# EAGLE design PCB_ESP32_v6 (EAGLE 9.7.0)
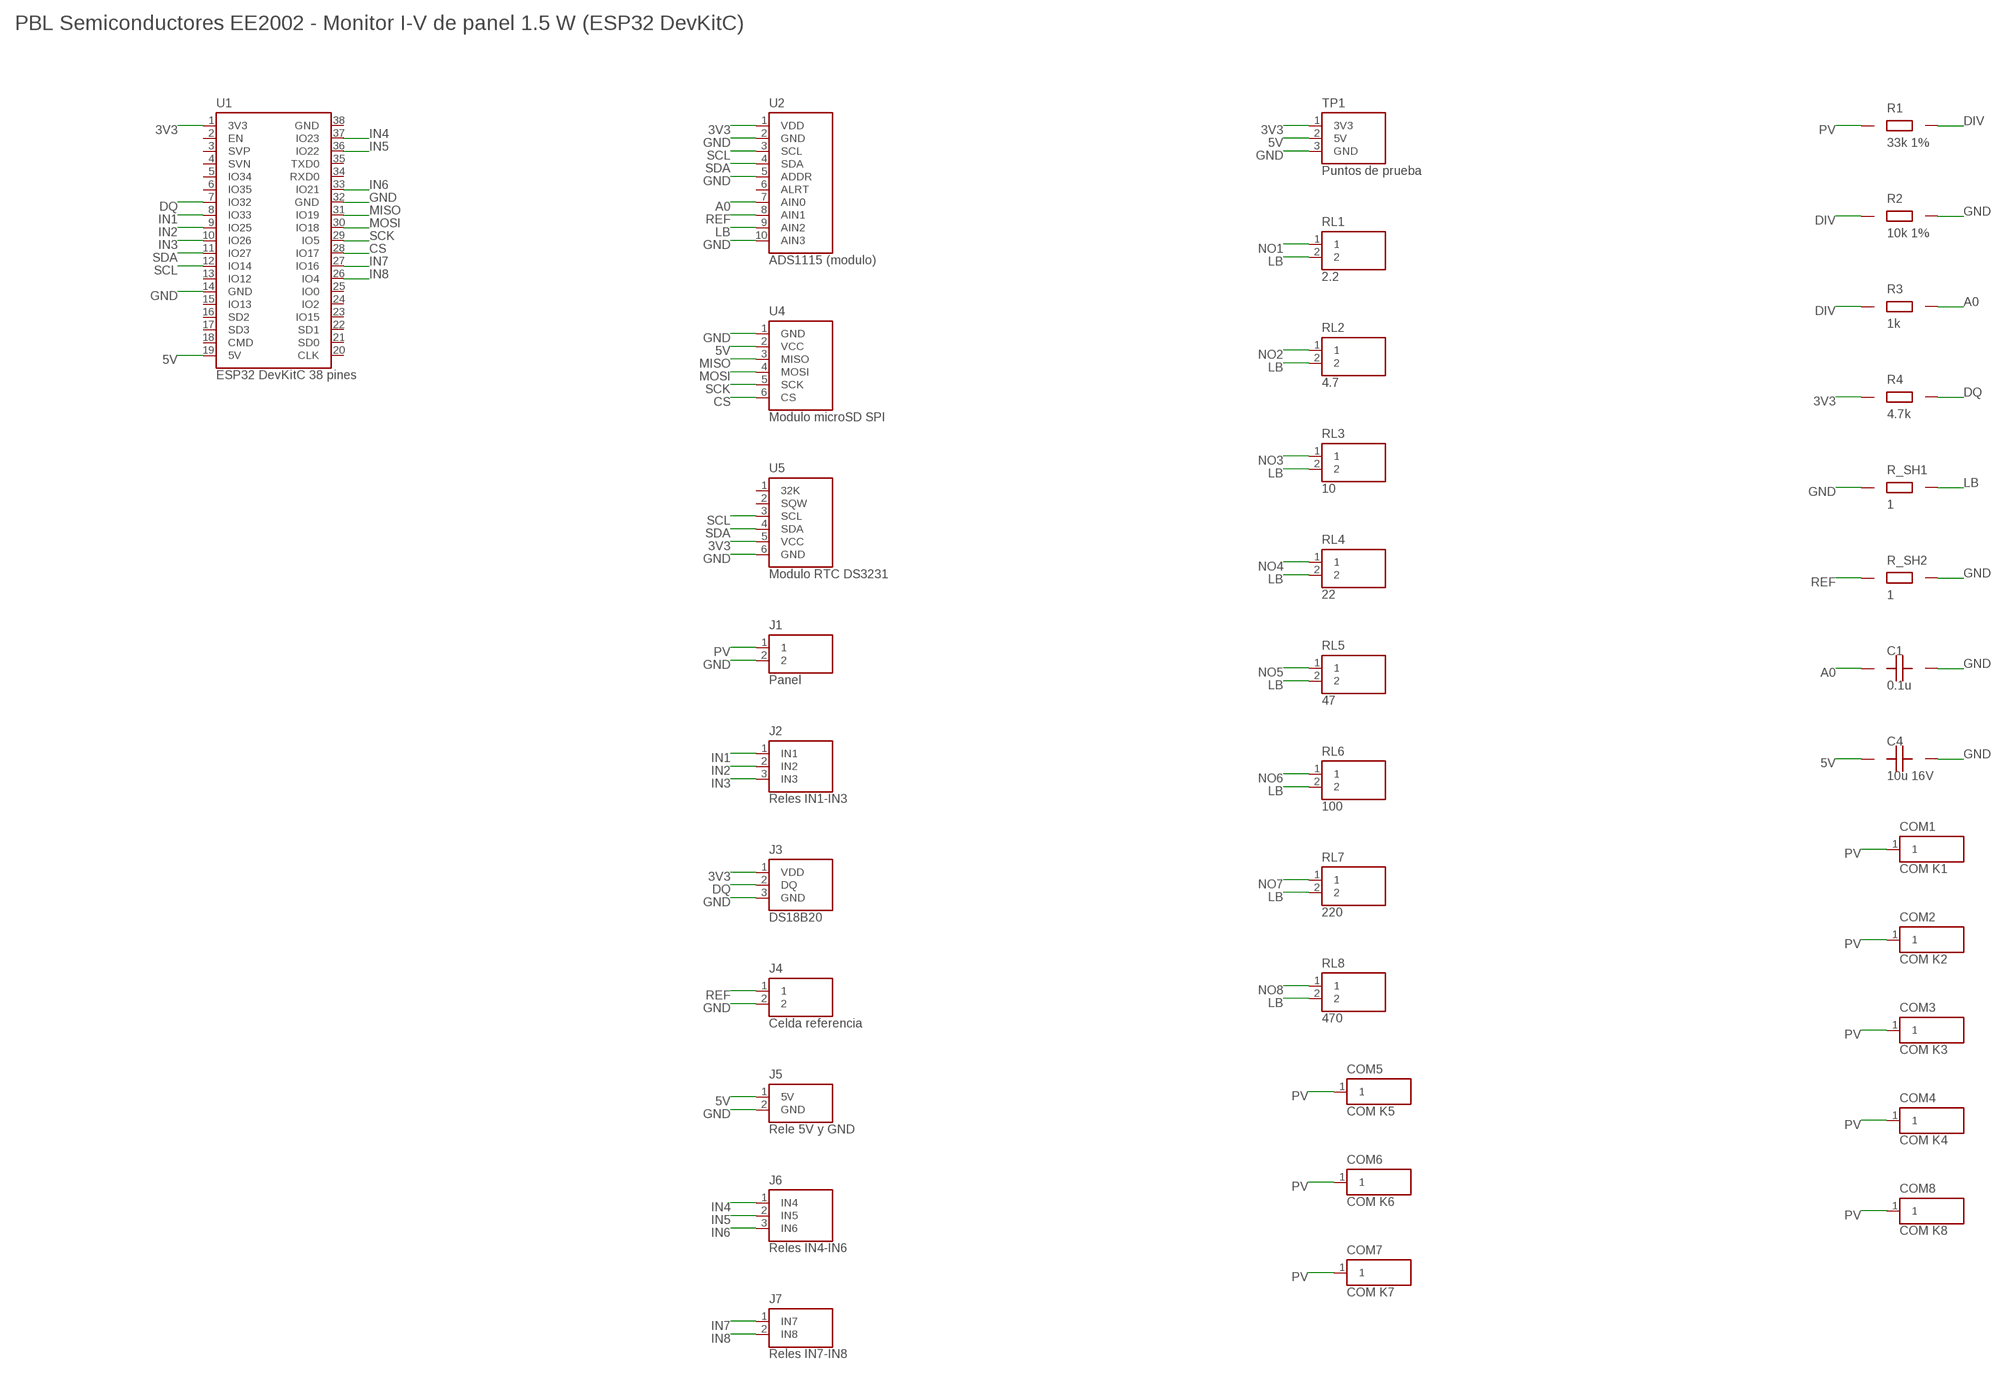
[diagram p0: schematic, sheet 1]

## Parts
C1  0.1u  C  [CAP_5MM]
C4  10u 16V  CP  [CAP_E_2_54]
COM1  COM K1  WIREPAD  [WIREPAD]
COM2  COM K2  WIREPAD  [WIREPAD]
COM3  COM K3  WIREPAD  [WIREPAD]
COM4  COM K4  WIREPAD  [WIREPAD]
COM5  COM K5  WIREPAD  [WIREPAD]
COM6  COM K6  WIREPAD  [WIREPAD]
COM7  COM K7  WIREPAD  [WIREPAD]
COM8  COM K8  WIREPAD  [WIREPAD]
J1  Panel  TERM2  [TERM2_5MM]
J2  Reles IN1-IN3  RELAY_L  [MALE_1X03]
J3  DS18B20  DS18B20_HDR  [MALE_1X03]
J4  Celda referencia  TERM2  [TERM2_5MM]
J5  Rele 5V y GND  RELAY_PWR  [MALE_1X02]
J6  Reles IN4-IN6  RELAY_RA  [MALE_1X03]
J7  Reles IN7-IN8  RELAY_RC  [MALE_1X02]
R1  33k 1%  R  [RES_V]
R2  10k 1%  R  [RES_V]
R3  1k  R  [RES_V]
R4  4.7k  R  [RES_V]
R_SH1  1  R  [RES_V]
R_SH2  1  R  [RES_V]
RL1  2.2  RLOAD  [RES_H_T]
RL2  4.7  RLOAD  [RES_H_T]
RL3  10  RLOAD  [RES_H_T]
RL4  22  RLOAD  [RES_H_T]
RL5  47  RLOAD  [RES_H_T]
RL6  100  RLOAD  [RES_H_T]
RL7  220  RLOAD  [RES_H_T]
RL8  470  RLOAD  [RES_H_T]
TP1  Puntos de prueba  TESTPOINTS  [MALE_1X03]
U1  ESP32 DevKitC 38 pines  ESP32  [ESP32_DEVKIT38]
U2  ADS1115 (modulo)  ADS1115  [SOCKET_1X10]
U4  Modulo microSD SPI  SDCARD  [SOCKET_1X06]
U5  Modulo RTC DS3231  DS3231  [SOCKET_1X06]

## Nets
3V3: J3.1(VDD) R4.1 TP1.1(3V3) U1.1(3V3) U2.1(VDD) U5.5(VCC)
5V: C4.1(+) J5.1(5V) TP1.2(5V) U1.19(5V) U4.2(VCC)
A0: C1.1 R3.2 U2.7(AIN0)
CS: U1.28(IO17) U4.6(CS)
DIV: R1.2 R2.1 R3.1
DQ: J3.2(DQ) R4.2 U1.7(IO32)
GND: C1.2 C4.2(-) J1.2 J3.3(GND) J4.2 J5.2(GND) R2.2 R_SH1.1 R_SH2.2 TP1.3(GND) U1.14(GND) U1.32(GND) U2.2(GND) U2.5(ADDR) U2.10(AIN3) U4.1(GND) U5.6(GND)
IN1: J2.1(IN1) U1.8(IO33)
IN2: J2.2(IN2) U1.9(IO25)
IN3: J2.3(IN3) U1.10(IO26)
IN4: J6.1(IN4) U1.37(IO23)
IN5: J6.2(IN5) U1.36(IO22)
IN6: J6.3(IN6) U1.33(IO21)
IN7: J7.1(IN7) U1.27(IO16)
IN8: J7.2(IN8) U1.26(IO4)
LB: R_SH1.2 RL1.2 RL2.2 RL3.2 RL4.2 RL5.2 RL6.2 RL7.2 RL8.2 U2.9(AIN2)
MISO: U1.31(IO19) U4.3(MISO)
MOSI: U1.30(IO18) U4.4(MOSI)
NO1: RL1.1
NO2: RL2.1
NO3: RL3.1
NO4: RL4.1
NO5: RL5.1
NO6: RL6.1
NO7: RL7.1
NO8: RL8.1
PV: COM1.1 COM2.1 COM3.1 COM4.1 COM5.1 COM6.1 COM7.1 COM8.1 J1.1 R1.1
REF: J4.1 R_SH2.1 U2.8(AIN1)
SCK: U1.29(IO5) U4.5(SCK)
SCL: U1.12(IO14) U2.3(SCL) U5.3(SCL)
SDA: U1.11(IO27) U2.4(SDA) U5.4(SDA)
Unconnected: U1.2(EN) U1.3(SVP) U1.4(SVN) U1.5(IO34) U1.6(IO35) U1.13(IO12) U1.15(IO13) U1.16(SD2) U1.17(SD3) U1.18(CMD) U1.20(CLK) U1.21(SD0) U1.22(SD1) U1.23(IO15) U1.24(IO2) U1.25(IO0) U1.34(RXD0) U1.35(TXD0) U1.38(GND) U2.6(ALRT) U5.1(32K) U5.2(SQW)

## Notes on the sheet
- PBL Semiconductores EE2002 - Monitor I-V de panel 1.5 W (ESP32 DevKitC)

## Library data of the parts
C1 = PCB_PBL_Semiconductores:C
C4 = PCB_PBL_Semiconductores:CP
COM1-COM8 = PCB_PBL_Semiconductores:WIREPAD
J1 J4 = PCB_PBL_Semiconductores:TERM2
J2 = PCB_PBL_Semiconductores:RELAY_L
J3 = PCB_PBL_Semiconductores:DS18B20_HDR
J5 = PCB_PBL_Semiconductores:RELAY_PWR
J6 = PCB_PBL_Semiconductores:RELAY_RA
J7 = PCB_PBL_Semiconductores:RELAY_RC
R1-R4 R_SH1 R_SH2 = PCB_PBL_Semiconductores:R
RL1-RL8 = PCB_PBL_Semiconductores:RLOAD
TP1 = PCB_PBL_Semiconductores:TESTPOINTS
U1 = PCB_PBL_Semiconductores:ESP32
U2 = PCB_PBL_Semiconductores:ADS1115
U4 = PCB_PBL_Semiconductores:SDCARD
U5 = PCB_PBL_Semiconductores:DS3231

## Board
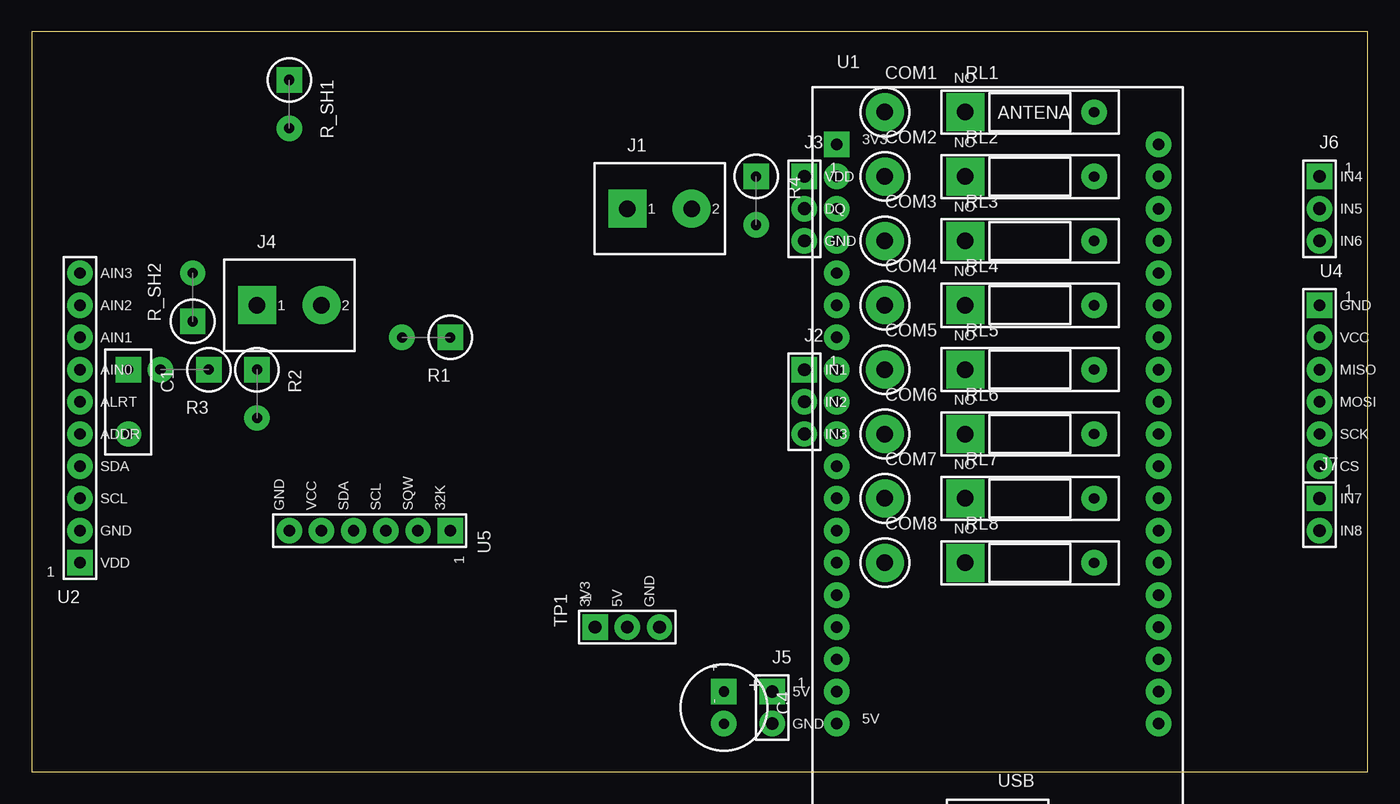
[diagram p1: board, top side]
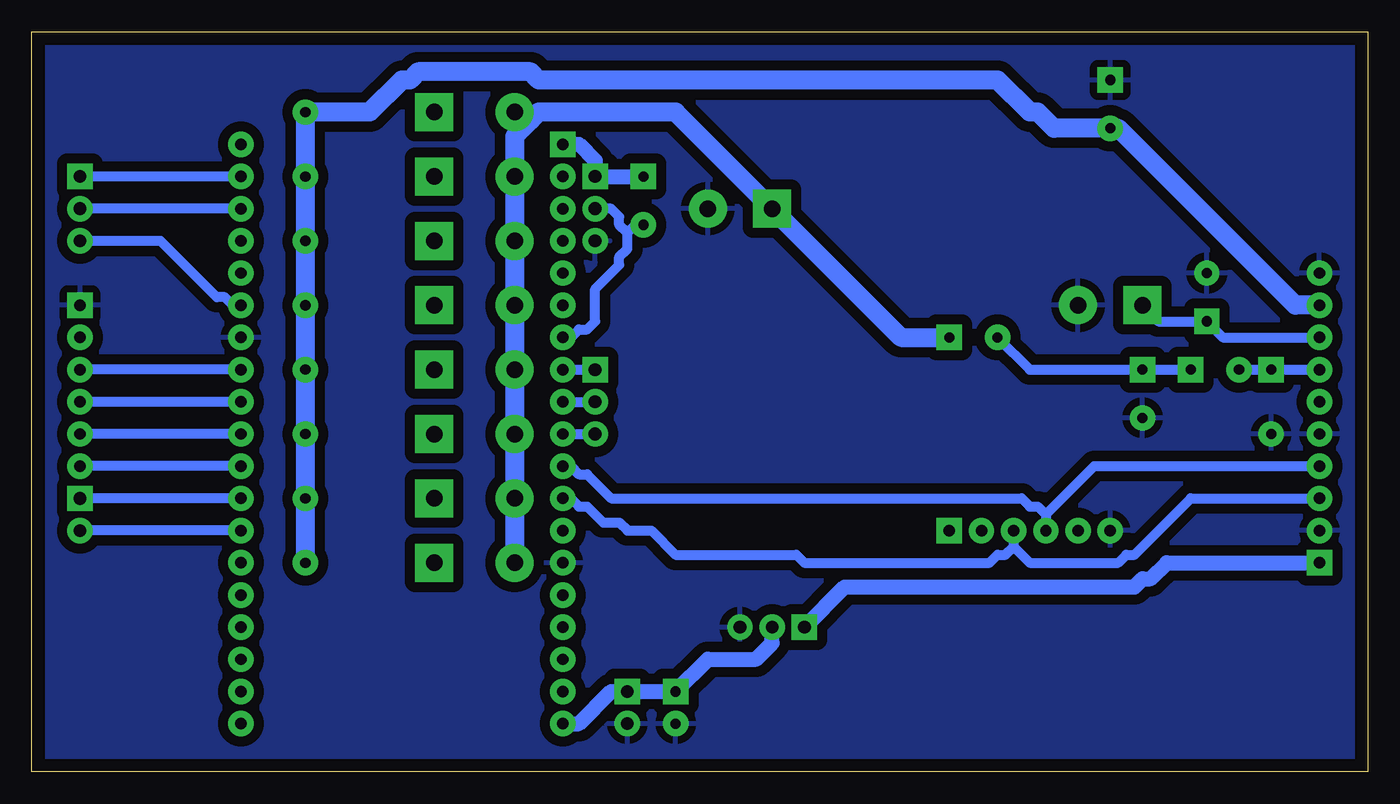
[diagram p2: board, bottom side, seen from below]

Size 105.41 x 58.42 mm. Coordinates in mm from the lower left corner, seen from the top.
Outline: 0,0 105.41,0 105.41,58.42 0,58.42 0,0
Copper layers (1*16): Top 0.035mm / dielectric 1.5mm / Bottom 0.035mm
Design rules "Fusion Electronics Design Rules": minimum track width 0.5mm, minimum drill 0.5mm, track to track 0.5mm, track to pad 0.5mm, pad to pad 0.5mm, via to via 0.5mm, smd to smd 6mil, copper to edge 1mm, drill to drill 0.3mm, minimum pad ring 0.4mm, minimum via ring 0.4mm, stop-mask expansion 4mil, vias tented up to drill 9999mil, thermal gap 0.6mm

### Footprints (pad centres in the part's own frame; a part is rotated, then mirrored left to right if it is on the bottom)
CAP_5MM = drill 0.8 pad 2 square: 1 0,0 | drill 0.8 pad 2 round: 2 5.08,0
CAP_E_2_54 = drill 0.8 pad 2 square: 1 0,0 | drill 0.8 pad 2 round: 2 2.54,0
WIREPAD = drill 1.3 pad 3 round: 1 0,0
TERM2_5MM = drill 1.3 pad 3 square: 1 0,0 | drill 1.3 pad 3 round: 2 5.08,0
MALE_1X03 = drill 1 pad 2 square: 1 0,0 | drill 1 pad 2 round: 2 0,-2.54; 3 0,-5.08
MALE_1X02 = drill 1 pad 2 square: 1 0,0 | drill 1 pad 2 round: 2 0,-2.54
RES_V = drill 0.8 pad 2 square: 1 0,0 | drill 0.8 pad 2 round: 2 3.81,0
RES_H_T = drill 1.3 pad 3 square: 1 0,0 | drill 0.8 pad 2 round: 2 10.16,0
ESP32_DEVKIT38 = drill 0.9 pad 2 square: 1 0,0 | drill 0.9 pad 2 round: 2 0,-2.54; 3 0,-5.08; 4 0,-7.62; 5 0,-10.16; 6 0,-12.7; 7 0,-15.24; 8 0,-17.78; 9 0,-20.32; 10 0,-22.86; 11 0,-25.4; 12 0,-27.94; 13 0,-30.48; 14 0,-33.02; 15 0,-35.56; 16 0,-38.1; 17 0,-40.64; 18 0,-43.18; 19 0,-45.72; 20 25.4,-45.72; 21 25.4,-43.18; 22 25.4,-40.64; 23 25.4,-38.1; 24 25.4,-35.56; 25 25.4,-33.02; 26 25.4,-30.48; 27 25.4,-27.94; 28 25.4,-25.4; 29 25.4,-22.86; 30 25.4,-20.32; 31 25.4,-17.78; 32 25.4,-15.24; 33 25.4,-12.7; 34 25.4,-10.16; 35 25.4,-7.62; 36 25.4,-5.08; 37 25.4,-2.54; 38 25.4,0
SOCKET_1X10 = drill 0.9 pad 2 square: 1 0,0 | drill 0.9 pad 2 round: 2 0,-2.54; 3 0,-5.08; 4 0,-7.62; 5 0,-10.16; 6 0,-12.7; 7 0,-15.24; 8 0,-17.78; 9 0,-20.32; 10 0,-22.86
SOCKET_1X06 = drill 0.9 pad 2 square: 1 0,0 | drill 0.9 pad 2 round: 2 0,-2.54; 3 0,-5.08; 4 0,-7.62; 5 0,-10.16; 6 0,-12.7

### Placement (x,y rotation side)
C1  7.62,31.75 270 top
C4  54.61,6.35 270 top
COM1  67.31,52.07 0 top
COM2  67.31,46.99 0 top
COM3  67.31,41.91 0 top
COM4  67.31,36.83 0 top
COM5  67.31,31.75 0 top
COM6  67.31,26.67 0 top
COM7  67.31,21.59 0 top
COM8  67.31,16.51 0 top
J1  46.99,44.45 0 top
J2  60.96,31.75 0 top
J3  60.96,46.99 0 top
J4  17.78,36.83 0 top
J5  58.42,6.35 0 top
J6  101.6,46.99 0 top
J7  101.6,21.59 0 top
R1  33.02,34.29 180 top
R2  17.78,31.75 270 top
R3  13.97,31.75 180 top
R4  57.15,46.99 270 top
R_SH1  20.32,54.61 270 top
R_SH2  12.7,35.56 90 top
RL1  73.66,52.07 0 top
RL2  73.66,46.99 0 top
RL3  73.66,41.91 0 top
RL4  73.66,36.83 0 top
RL5  73.66,31.75 0 top
RL6  73.66,26.67 0 top
RL7  73.66,21.59 0 top
RL8  73.66,16.51 0 top
TP1  44.45,11.43 90 top
U1  63.5,49.53 0 top
U2  3.81,16.51 180 top
U4  101.6,36.83 0 top
U5  33.02,19.05 270 top

### Tracks (layer width: path | path; a pad name or v marks a point on that pad's centre or on a via)
3V3
  Bottom 1.2: U1.1 62.23,49.53 60.96,48.26 J3.1 R4.1 | TP1.1 41.27,14.61 18.41,14.61 17.78,15.24 17.14,15.24 15.88,16.51 U2.1
  tDocu 0.3: R4.1 TP1.1 | U2.1 U5.5
5V
  Bottom 1.2: U1.19 62.23,3.81 59.69,6.35 J5.1 C4.1 52.07,8.89 48.26,8.89 46.99,10.16 TP1.2
  tDocu 0.3: U1.19 U4.2
A0
  Bottom 0.8: R3.2 C1.1 U2.7
CS
  Bottom 0.8: U1.28 U4.6
DIV
  Bottom 0.8: R1.2 26.67,31.75 R2.1 R3.1
DQ
  Bottom 0.8: U1.7 62.87,34.29 62.23,34.93 61.59,34.93 60.96,35.56 60.96,38.1 59.05,40.01 59.05,40.64 58.42,41.27 58.42,42.54 | 58.42,42.54 59.05,43.18 59.05,43.82 59.69,44.45 J3.2 | 58.42,42.54 57.78,43.18 R4.2
GND
  tDocu 0.3: U5.6 R2.2 | J3.3 J1.2
  pour Bottom (isolate 0.8): 0.8,0.8 104.61,0.8 104.61,57.62 0.8,57.62
IN1
  Bottom 0.8: U1.8 J2.1
IN2
  Bottom 0.8: U1.9 J2.2
IN3
  Bottom 0.8: U1.10 J2.3
IN4
  Bottom 0.8: U1.37 J6.1
IN5
  Bottom 0.8: U1.36 J6.2
IN6
  Bottom 0.8: U1.33 89.53,36.83 90.17,37.46 90.81,37.46 95.25,41.91 J6.3
IN7
  Bottom 0.8: U1.27 J7.1
IN8
  Bottom 0.8: U1.26 J7.2
LB
  Bottom 1.5: U2.9 5.71,36.83 19.68,50.8 R_SH1.2 24.77,50.8 26.04,52.07 26.67,52.07 29.21,54.61 65.41,54.61 66.04,55.24 74.93,55.24 75.56,54.61 76.2,54.61 78.74,52.07 RL1.2 RL2.2 RL3.2 RL4.2 RL5.2 RL6.2 RL7.2 RL8.2
MISO
  Bottom 0.8: U1.31 U4.3
MOSI
  Bottom 0.8: U1.30 U4.4
PV
  Bottom 1.5: 66.04,51.43 66.67,52.07 COM1.1 | COM8.1 COM7.1 COM6.1 COM5.1 COM4.1 COM3.1 COM2.1 67.31,50.16 65.41,52.07 54.61,52.07 J1.1 36.83,34.29 R1.1
REF
  Bottom 0.8: J4.1 16.51,35.56 R_SH2.1 11.43,34.29 U2.8
SCK
  Bottom 0.8: U1.29 U4.5
SCL
  Bottom 0.8: U1.12 62.87,21.59 62.23,20.95 61.59,20.95 60.33,19.69 59.05,19.69 58.42,19.05 56.52,19.05 54.61,17.15 45.09,17.15 44.45,16.51 29.84,16.51 29.21,17.15 28.57,17.15 27.94,17.78 | 27.94,17.78 U5.3 | 27.94,17.78 26.67,16.51 19.68,16.51 19.05,17.15 18.41,17.15 13.97,21.59 U2.3
SDA
  Bottom 0.8: U1.11 62.87,24.13 62.23,23.49 61.59,23.49 59.69,21.59 27.3,21.59 26.67,20.95 26.04,20.95 25.4,20.32 | 25.4,20.32 U5.4 | 25.4,20.32 21.59,24.13 U2.4

### Text on the board
tPlace: VDD | IN4 | 1 | 2 | DQ | IN5 | GND | IN6 | AIN3 | AIN2 | 1 | 2 | GND | AIN1 | VCC | AIN0 | IN1 | MISO | ALRT | IN2 | MOSI | ADDR | IN3 | SCK | SDA | CS | SCL | GND | VCC | SDA | SCL | SQW | 32K | IN7 | GND | IN8 | VDD | 3V3 | 5V | GND | + | - | 5V | GND